# Altium schematic sheet Digital circuit.SchDoc
size A; SheetNumber: 2; SheetTotal: 5
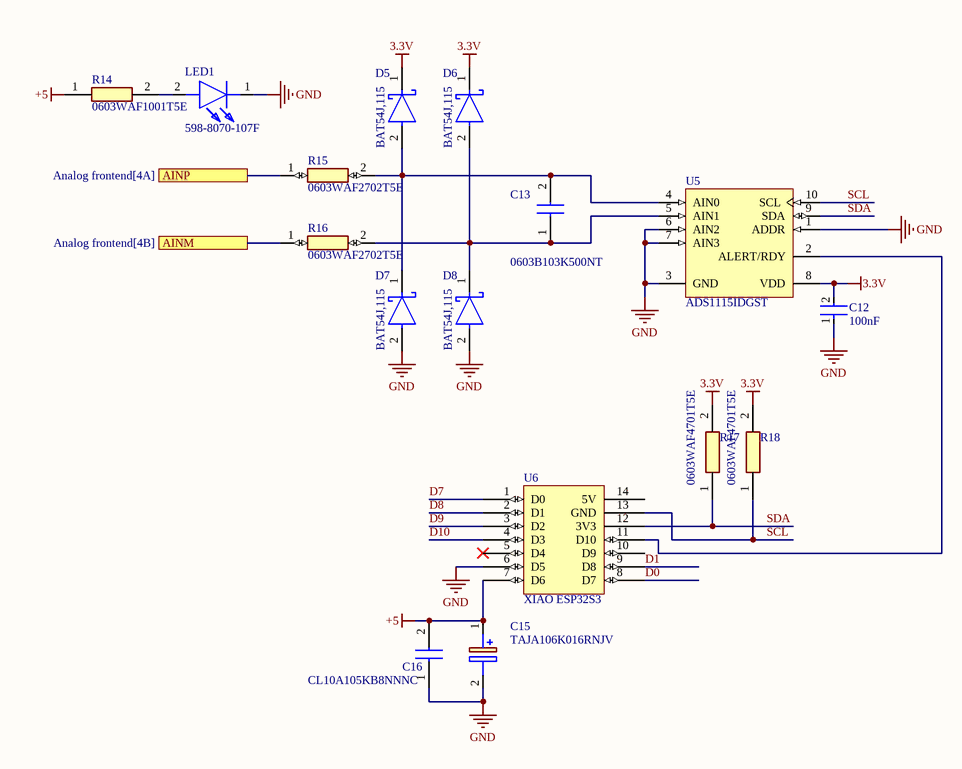
[diagram p0: Digital circuit.SchDoc]

## Parts
C12  value 100nF  [FP-CC0603-DA-IPC_B]  (hidden comment: CC0603KRX7R9BB104)
C13  0603B103K500NT  [CAPC1608X90N]
C15  TAJA106K016RNJV  [CAPPM3216X180N]
C16  CL10A105KB8NNNC  [CAPC1608X90N]
D5  BAT54J,115  [FP-SOD323F-MFG]
D6  BAT54J,115  [FP-SOD323F-MFG]
D7  BAT54J,115  [FP-SOD323F-MFG]
D8  BAT54J,115  [FP-SOD323F-MFG]
LED1  598-8070-107F  [5988070107F]
R14  0603WAF1001T5E  [RESC1608X55N]
R15  0603WAF2702T5E  [RESC1608X55N]
R16  0603WAF2702T5E  [RESC1608X55N]
R17  0603WAF4701T5E  [RESC1608X55N]
R18  0603WAF4701T5E  [RESC1608X55N]
U5  ADS1115IDGST  [TI-DGS10_L]
U6  XIAO ESP32S3  [XIAO ESP32S3-Footprint-1]

## Ports
AINM (see Analog frontend[4B]), AINP (see Analog frontend[4A])

## Nets
3.3V: C12.2 D5.1(C) D6.1(C) R17.2 R18.2 U5.8(VDD)
+5: C15.1(+) C16.2 R14.1 U6.7(D6)
GND: C12.1 C15.2(-) C16.1 D7.2(A) D8.2(A) LED1.1(K) U5.1(ADDR) U5.3(GND) U5.6(AIN2) U5.7(AIN3) U6.6(D5)
AINM: R16.1 ; port AINM
AINP: R15.1 ; port AINP
D0: U6.8(D7)
D1: U6.9(D8)
D7: U6.1(D0)
D8: U6.2(D1)
D9: U6.3(D2)
D10: U6.4(D3)
SCL: R18.1 U5.10(SCL) U6.13(GND)
SDA: R17.1 U5.9(SDA) U6.12(3V3)
NetC13_1: C13.1 D6.2(A) D8.1(C) R16.2 U5.5(AIN1)
NetC13_2: C13.2 D5.2(A) D7.1(C) R15.2 U5.4(AIN0)
NetLED1_2: LED1.2(A) R14.2
NetU5_2: U5.2(ALERT/RDY) U6.11(D10)

Not connected (* = marked no-connect by the designer): U6 5(D4)* 10(D9) 14(5V)

## Library data of the parts
C12 = CMP-001-00148-1: Multilayer Ceramic Capacitor, CC Series, 0.1 - F, - 10%, X7R, 50 V, 0603 [1608 Metric]; Voltage Rating: 50V; Mounting Technology: Surface Mount; Tolerance: 10%; Case/Package: 0603; Max Operating Temperature: 125°C; Min Operating Temperature: -55°C; Pins: 2; Lead Free: Lead Free; Case Code (Metric): 1608; Width: 800µm; Termination: SMD/SMT; Depth: 800µm; RoHS: Compliant; Material: Ceramic; Dielectric: X7R; Schedule B: 8532240020, 8532240020; Country of Origin: Mainland China, Taiwan; Lifecycle Status: Production; Radiation Hardening: No; Case Code (Imperial): 0603; Height: 800µm; Number of Terminals: 2; China RoHS: Compliant; Voltage Rating (DC): 50V; Export Control Classification Number (ECCN) Code: EAR99; Halogen Free: Halogen Free; Thickness: 889µm; Voltage: 50V; Length: 1.6mm; Harmonized Tariff Schedule (HTS) Code: 8532.24.00.20; REACH SVHC: Unaffected; Introduction Date: 2005-08-18; Dielectric Material: Ceramic
C13 = 0603B103K500NT: Capacitor; Manufacturer_Name: Fenghua Advanced Technology (Holding) CO.; Datasheet Link: https://www.datasheets360.com/pdf/5043620394403009653; Height: 0.9mm; Manufacturer_Part_Number: 0603B103K500NT
C15 = TAJA106K016RNJV: Capacitor Polarised; Manufacturer_Name: Kyocera AVX; Datasheet Link: http://www.farnell.com/datasheets/1680476.pdf; Height: 1.8mm; Manufacturer_Part_Number: TAJA106K016RNJV; Mouser Part Number: 581-TAJA106K016RNJV; Mouser Price/Stock: https://www.mouser.co.uk/ProductDetail/KYOCERA-AVX/TAJA106K016RNJV?qs=X421pCAdHWe2u1fVMeO6XQ%3D%3D; Arrow Part Number: TAJA106K016RNJV; Arrow Price/Stock: https://www.arrow.com/en/products/taja106k016rnjv/avx?utm_currency=USD&region=nac
C16 = CL10A105KB8NNNC: Capacitor; Manufacturer_Name: SAMSUNG; Datasheet Link: https://datasheet.datasheetarchive.com/originals/distributors/Datasheets-DGA10/2411562.pdf; Height: 0.9mm; Manufacturer_Part_Number: CL10A105KB8NNNC; Mouser Part Number: 187-CL10A105KB8NNNC; Mouser Price/Stock: https://www.mouser.co.uk/ProductDetail/Samsung-Electro-Mechanics/CL10A105KB8NNNC?qs=ktYoCbbtCSJz4pFCLWXd5g%3D%3D; Arrow Part Number: CL10A105KB8NNNC; Arrow Price/Stock: https://www.arrow.com/en/products/cl10a105kb8nnnc/samsung-electro-mechanics.html?utm_currency=USD&region=nac
D5-D8 = CMP-004-00052-1: BAT54 Series 30 V 0.2 A Surfacec Mount Schottky Diode - SOD-323F; Manufacturer Lifecycle Status: RELEASED FOR SUPPLY; Max Reverse Voltage (DC): 30V; Max Output current: 200mA; Max Power Dissipation: 550mW; Forward Voltage: 240mV; Peak Non-Repetitive Surge Current: 600mA; Element Configuration: Single; Reverse Standoff Voltage: 25V; Value: 10pF; Max Junction Temperature (Tj): 150°C; Max Reverse Leakage Current: 2µA; Number of Elements: 1; RoHS: Compliant; Lead Free: Lead Free; Export Control Classification Number (ECCN) Code: EAR99; Forward Current: 200mA; Height: 800µm; REACH SVHC: Yes; Reverse Voltage: 30V; Max Repetitive Reverse Voltage (Vrrm): 30V; Radiation Hardening: No; Pins: 2; Max Surge Current: 600mA; Schedule B: 8541100070, 8541100070; Contact Plating: Tin; Mounting Technology: Surface Mount; Harmonized Tariff Schedule (HTS) Code: 8541.10.00.70; Peak Reverse Current: 2µA; Lifecycle Status: Production; China RoHS: Compliant; Average Rectified Current: 200mA; Ambient Temperature Range High: 150°C; Number of Terminals: 2; Max Operating Temperature: 150°C; Max Forward Surge Current (Ifsm): 600mA; Introduction Date: 2007-03-09; Country of Origin: Mainland China, Malaysia; Min Operating Temperature: -65°C
LED1 = 598-8070-107F: LED; Manufacturer_Name: Dialight; Datasheet Link: https://www.mouser.in/datasheet/2/109/Dialight_CBI_data_598_0603_Apr2018-2944350.pdf; Height: 0.8mm; Manufacturer_Part_Number: 598-8070-107F; Mouser Part Number: 645-598-8070-107F; Mouser Price/Stock: https://www.mouser.co.uk/ProductDetail/Dialight/598-8070-107F?qs=7JStj%2FjQ2SEP6f6GzqcocA%3D%3D; Arrow Part Number: 598-8070-107F; Arrow Price/Stock: https://www.arrow.com/en/products/598-8070-107f/dialight?region=nac
R14 = 0603WAF1001T5E: Resistor; Manufacturer_Name: UNI-ROYAL(Uniroyal Elec); Datasheet Link: https://datasheet.lcsc.com/szlcsc/Uniroyal-Elec-0603WAF1001T5E_C21190.pdf; Height: 0.55mm; Manufacturer_Part_Number: 0603WAF1001T5E
R15 R16 = 0603WAF2702T5E: Resistor; Manufacturer_Name: UNI-ROYAL(Uniroyal Elec); Datasheet Link: https://datasheet.lcsc.com/lcsc/2110252130_UNI-ROYAL-Uniroyal-Elec-0603WAF2702T5E_C22967.pdf; Height: 0.55mm; Manufacturer_Part_Number: 0603WAF2702T5E
R17 R18 = 0603WAF4701T5E: Resistor; Manufacturer_Name: UNI-ROYAL(Uniroyal Elec); Datasheet Link: https://datasheet.lcsc.com/szlcsc/Uniroyal-Elec-0603WAF4701T5E_C23162.pdf; Height: 0.55mm; Manufacturer_Part_Number: 0603WAF4701T5E
U5 = CMP-014-00008-1: 4-Channel Single ADC Delta-Sigma 860sps 16-bit Serial 10-Pin VSSOP T/R; Manufacturer Lifecycle Status: ACTIVE; Min Supply Voltage: 2V; Resolution: 2B; Number of A/D Converters: 1; Max Power Dissipation: 500µW; Nominal Supply Current: 150µA; Polarity: Bipolar; Max Supply Voltage: 5.5V; Interface: I2C; Power Dissipation: 900µW; Number of Bits: 16; Number of Channels: 4; Operating Supply Voltage: 3.3V; Integral Nonlinearity (INL): 1LSB; Termination: SMD/SMT; Case/Package: VSSOP; Width: 3mm; Contact Plating: Gold; REACH SVHC: No; Pins: 10; Number of Converters: 1; Max Operating Temperature: 125°C; Thickness: 1.02mm; Lead Free: Lead Free; Number of Elements: 1; Height: 1.07mm; Min Supply Voltage (DC): 2V; Lifecycle Status: Production; RoHS: Compliant; Conversion Rate: 860sps; Schedule B: 8542390000, 8542390000; Radiation Hardening: No; Supply Type: Single; Number of Inputs: 4; Sampling Rate: 860sps; Length: 3mm; Min Operating Temperature: -40°C; Max Supply Voltage (DC): 5.5V
U6 = CMP-020-00029-1